# Altium project PCB_Project.PrjPcb
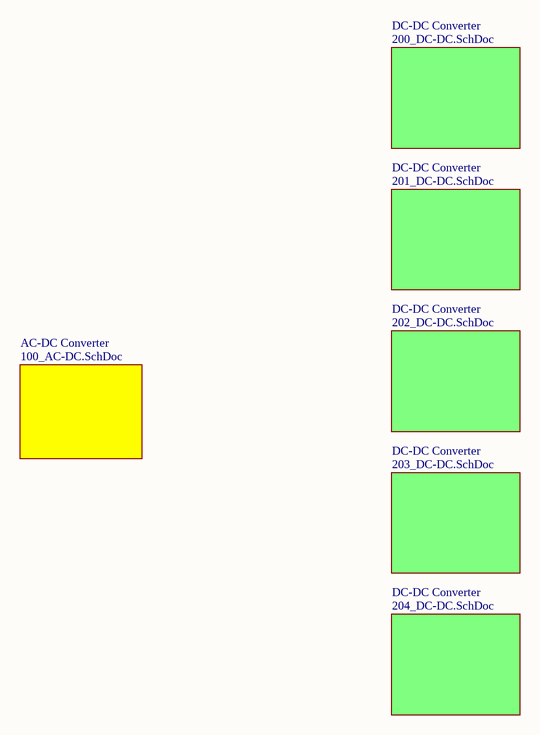
[diagram p0: 000_Hierarchical.SchDoc]
7 sheets, 69 parts. Net scope: global (net labels, ports and power ports of the same name join across sheets).
Board file: 100_AC-DC.PcbDoc
Sheets:
  000_Hierarchical.SchDoc
    AC-DC Converter = 100_AC-DC.SchDoc
    DC-DC Converter = 200_DC-DC.SchDoc
    DC-DC Converter = 202_DC-DC.SchDoc
    DC-DC Converter = 201_DC-DC.SchDoc
    DC-DC Converter = 203_DC-DC.SchDoc
    DC-DC Converter = 204_DC-DC.SchDoc

## Sheet 000_Hierarchical.SchDoc: Hierarchical system
size A4; Date: xxxxxx; Author: R.Ducuara; DrawnBy: J.Jaramillo; Revision: R1V0; SheetNumber: 1; SheetTotal: 7

### Sub-sheets
AC-DC Converter = 100_AC-DC.SchDoc: no entries
DC-DC Converter = 200_DC-DC.SchDoc: no entries
DC-DC Converter = 202_DC-DC.SchDoc: no entries
DC-DC Converter = 201_DC-DC.SchDoc: no entries
DC-DC Converter = 203_DC-DC.SchDoc: no entries
DC-DC Converter = 204_DC-DC.SchDoc: no entries

### Notes on the sheet
- Title:
- Project:
- File:
- Revision:
- Date:
- Size:
- A4
- Drawn by:

## Sheet 100_AC-DC.SchDoc: AC-DC Converter
size A4; Date: xxxxxx; Author: R.Ducuara; DrawnBy: J.Jaramillo; Revision: R1V0; SheetNumber: 2; SheetTotal: 7
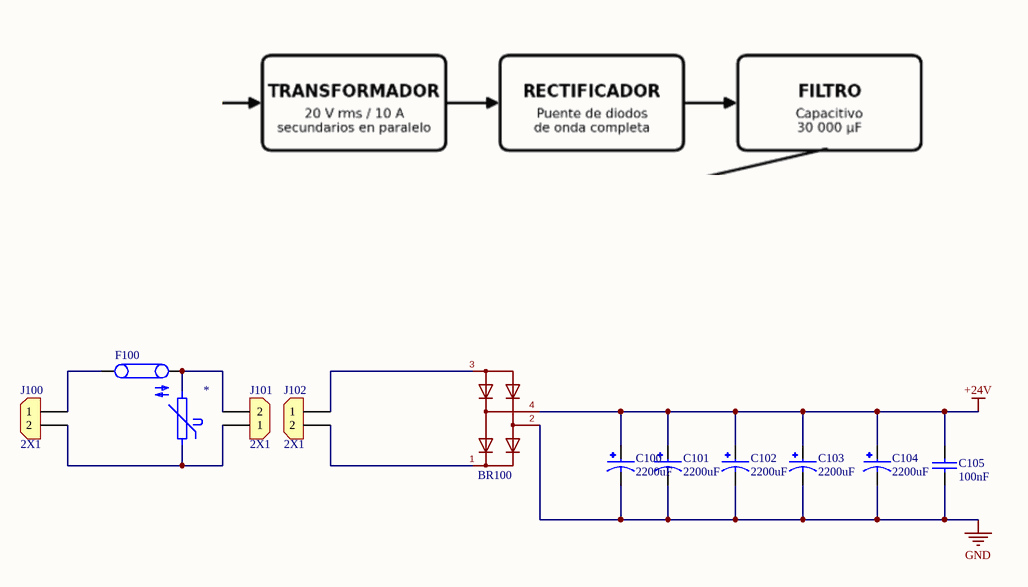
[diagram p1: 100_AC-DC.SchDoc]

### Parts
*  RV_Varistor_300VAC_125J_D14  [RV_Varistor_300VAC_125J_D14]  (value not drawn)
BR100  1000V 25A  [D_Bridge_1000V_25A_KBPC_FP]  (value not drawn)
C100  value 2200uF  [C_Alum_2200uF_50V_D18]  (hidden comment: C_Alum_2200uF_50V_D18)
C101  value 2200uF  [C_Alum_2200uF_50V_D18]  (hidden comment: C_Alum_2200uF_50V_D18)
C102  value 2200uF  [C_Alum_2200uF_50V_D18]  (hidden comment: C_Alum_2200uF_50V_D18)
C103  value 2200uF  [C_Alum_2200uF_50V_D18]  (hidden comment: C_Alum_2200uF_50V_D18)
C104  value 2200uF  [C_Alum_2200uF_50V_D18]  (hidden comment: C_Alum_2200uF_50V_D18)
C105  value 100nF  [1206]  (hidden comment: 100nF 100V)
F100  500V 10A  [FUSE_HLD_CARTRIDGE_5x20mm]  (value not drawn)
J100  2X1  [CON_2X1_TH_5MM_BAT]
J101  2X1  [CON_2X1_TH_5MM_BAT]
J102  2X1  [CON_2X1_TH_5MM_BAT]

### Nets
+24V: BR100.4(Input_~) C100.P C101.P C102.P C103.P C104.P C105.1
GND: BR100.2(Input_~) C100.N C101.N C102.N C103.N C104.N C105.2
Net*_1: *.1 J100.2 J101.1
Net*_2: *.2 F100.2 J101.2
NetBR100_1: BR100.1(+) J102.2
NetBR100_3: BR100.3(-) J102.1
NetF100_1: F100.1 J100.1

### Notes on the sheet
- Title:
- Project:
- File:
- Revision:
- Date:
- Size:
- A4
- Drawn by:

### Library data of the parts
* = RV_Varistor_300VAC_125J_D14: 470 V 6 kA Varistor 1 Circuitos Orificio pasante Tipo moneda 14mm; Manufacturer: TDK; Manufacturer Part Number: B72214P2301K101; Reel Sotck: N/A; Last modified by: R.Ducuara; Last modified date: 20261120
BR100 = D_Bridge_1000V_25A_KBPC_FP: Rectificador de puente Single Phase Estándar 1 kV Montaje de chasis KBPC FP; Manufacturer: Diotec Semiconductor; Manufacturer Part Number: KBPC10/15/2510FP; Supplier 1: Digikey; Supplier Part Number 1: 4878-KBPC10/15/2510FP-ND; Reel Stock: N/A; Last modified by: R.Ducuara; Last modified date: 20261120
C100-C104 = C_Alum_2200uF_50V_D18: Capacitores electrolíticos de aluminio 2200 µF 50 V Radial, encapsulado 2000 h a 105°C; Manufacturer: Panasonic Industry; Manufacturer Part Number: EEU-HD1H222; Supplier 1: Digi-Key; Supplier Part Number 1: P15152-ND; Last modified by: R.Ducuara; Last modified date: 20261120
C105 = Cap_0.1uF_1206_100V: CAP CER 0.1UF 100V X7R 1206; Manufacturer: Samsung Electro-Mechanics; Manufacturer Part Number: CL31B104KCFNNNE; Supplier 1: Digi-Key; Supplier Part Number 1: 1276-1151-1-ND; Last modified by: J.Jaramillo; Last modified date: 20240309; ComponentLink1Description: Digi-Key; ComponentLink1URL: https://www.digikey.com/en/products/detail/samsung-electro-mechanics/CL31B104KCFNNNE/3886809
F100 = F_HLD_CARTRIDGE_5x20mm: FUSE BLOK CARTRIDGE 500V 10A PCB; Manufacturer: Schurter Inc.; Manufacturer Part Number: 0031.8201; Supplier 1: Digi-Key; Supplier Part Number 1: 486-1258-ND; Reel Sotck: N/A; Last modified by: J.Jaramillo; Last modified date: 20240309; ComponentLink1Description: Digi-Key; ComponentLink1URL: https://www.digikey.com/en/products/detail/schurter-inc/0031-8201/669925?s=N4IgTCBcDaIAxwMwEYB0AOMdkgLoF8g
J100-J102 = Con_2x1_TH_5mm_Battery: Power Connectors ROHS; Manufacturer: Changzhou Amass Elec; Manufacturer Part Number: XT30U-M; Supplier 1: LCSC; Supplier Part Number 1: C99101; Reel Stock: N/A; Last modified by: J.Jaramillo; Last modified date: 20240310; ComponentLink1Description: Digi-Key; ComponentLink1URL: https://lcsc.com/product-detail/Power-Connectors_Changzhou-Amass-Elec-XT30U-M_C99101.html

## Sheet 200_DC-DC.SchDoc: DC_DC Convertion Stage
size A4; Date: xxxxxx; Author: R.Ducuara; DrawnBy: J.Jaramillo; Revision: R1V0; SheetNumber: 3; SheetTotal: 7
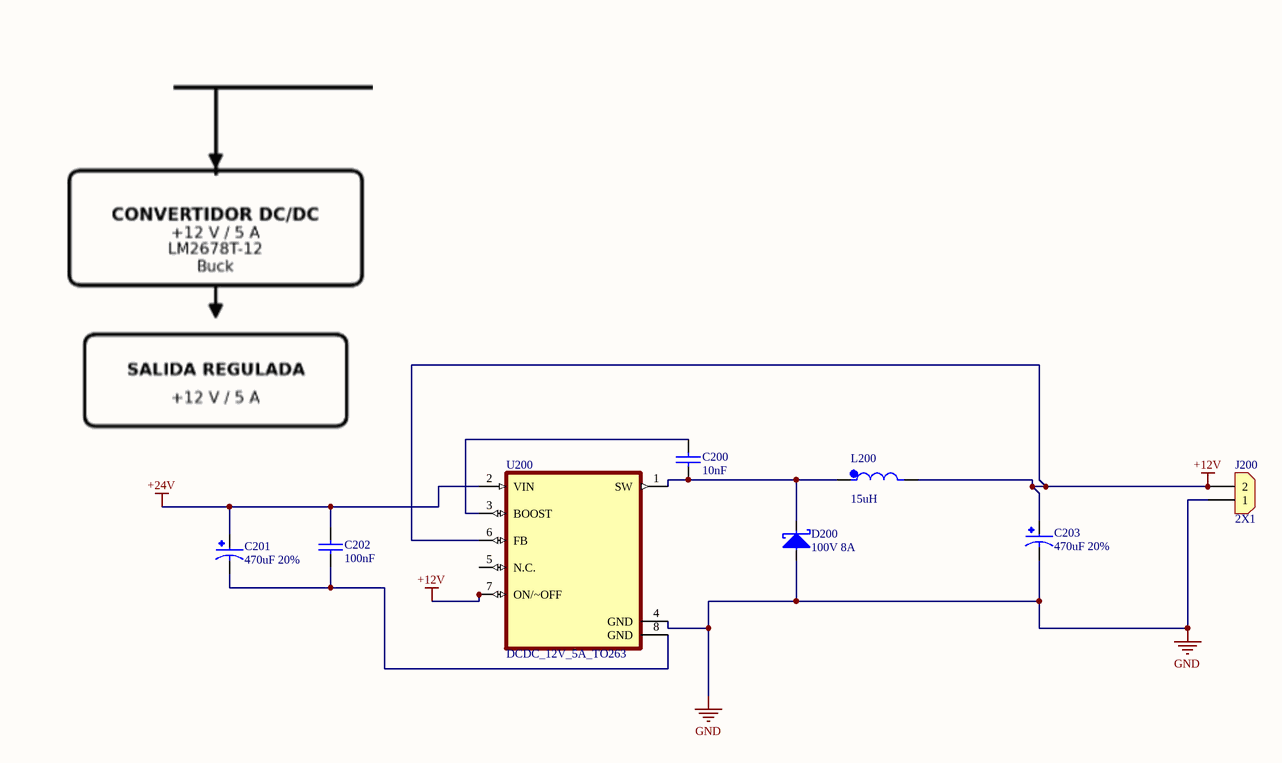
[diagram p2: 200_DC-DC.SchDoc]

### Parts
C200  value 10nF  [0805]  (hidden comment: 10000pF 50V)
C201  470uF 20%  [Cap_470uF_35V_ALUM_RAD]
C202  value 100nF  [1206]  (hidden comment: 100nF 100V)
C203  470uF 20%  [Cap_470uF_35V_ALUM_RAD]
D200  100V 8A  [DO_214AB]
J200  2X1  [CON_2X1_TH_5MM_BAT]
L200  15uH  [L_15uH_7A_SMD]
U200  DCDC_12V_5A_TO263  [DCDC_12V_5A_TO263]

### Nets
+12V: C203.P J200.2 L200.2 U200.6(FB) U200.7(ON/~OFF)
+24V: C201.P C202.1 U200.2(VIN)
GND: C203.N D200.2 J200.1 U200.4(GND)
NetC200_1: C200.1 U200.3(BOOST)
NetC200_2: C200.2 D200.1 L200.1 U200.1(SW)
NetC201_N: C201.N C202.2 U200.8(GND)

Not connected (* = marked no-connect by the designer): U200 5(N.C.)

### Notes on the sheet
- Title:
- Project:
- File:
- Revision:
- Date:
- Size:
- A4
- Drawn by:

### Library data of the parts
C200 = Cap_10000pF_0805_50V: CAP CER 10000PF 50V X7R 0805; Manufacturer: Yageo; Manufacturer Part Number: CC0805JRX7R9BB103; Supplier 1: Digi-Key; Supplier Part Number 1: 311-1857-1-ND; Reel stock: N/A; Last modified by: J.Jaramillo; Last modified date: 20240309; ComponentLink1Description: Digi-Key; ComponentLink1URL: https://www.digikey.com/product-detail/en/yageo/CC0805JRX7R9BB103/311-1857-1-ND/5195759
C201 C203 = Cap_470uF_35V_ALUM_RAD: CAP ALUM 470UF 20% 35V RADIAL TH; Manufacturer: Panasonic Industry; Manufacturer Part Number: ECA-1VM471B; Supplier 1: Digi-Key; Supplier Part Number 1: 10-ECA-1VM471BCT-ND; Last modified by: R.Ducuara; Last modified date: 20261121; Value: 470uF
C202 = Cap_0.1uF_1206_100V: as C105 on sheet 100_AC-DC; Supplier 1: Digi-Key; Supplier Part Number 1: 1276-1151-1-ND; Last modified by: J.Jaramillo; Last modified date: 20240309; ComponentLink1Description: Digi-Key; ComponentLink1URL: https://www.digikey.com/en/products/detail/samsung-electro-mechanics/CL31B104KCFNNNE/3886809
D200 = D_Schottky_100V_8A_DO_214AB: DIODE SCHOTTKY 100V 8A DO214AB; Manufacturer: Micro Commercial Co; Manufacturer Part Number: SK810L-TP; Supplier 1: Digi-key; Supplier Part Number 1: SK810L-TPMSCT-ND; Reel Stock: N/A; Last modified by: J.Jaramillo; Last modified date: 20240310; ComponentLink1Description: Digi-key; ComponentLink1URL: https://www.digikey.com/en/products/detail/micro-commercial-co/SK810L-TP/2650905?s=N4IgTCBcDaIMoGkAcBGADAGQLQBUAKIAugL5A
J200 = Con_2x1_TH_5mm_Battery: as J100 on sheet 100_AC-DC; Supplier 1: LCSC; Supplier Part Number 1: C99101; Reel Stock: N/A; Last modified by: J.Jaramillo; Last modified date: 20240310; ComponentLink1Description: Digi-Key; ComponentLink1URL: https://lcsc.com/product-detail/Power-Connectors_Changzhou-Amass-Elec-XT30U-M_C99101.html
L200 = L_15uH_7A_SMD: 15 µH Blindado Núcleo de tambor, cableado Inductivo 7 A 50mOhm máx. No estándar; Manufacturer: Bourns Inc.; Manufacturer Part Number: SRP1040VA-150M; Supplier 1: Digi-key; Supplier Part Number 1: 118-SRP1040VA-150MCT-ND; Reel Stock: N/A; Last modified by: R.Ducuara; Last modified date: 21/11/2026
U200 = DCDC_12V_5A_TO263: IC REG BUCK 12V 5A TO263; Manufacturer: Texas Instruments; Manufacturer Part Number: LM2678S-12; Supplier 1: Digikey; Supplier Part Number 1: LM2678S-12-ND; Reel Stock: N/A; Last modified by: R.Ducuara; Last modified date: 20261120

## Sheet 202_DC-DC.SchDoc: DC-DC
size A4; Date: XXXXXX; Author: R.Ducuara; DrawnBy: J.Jaramillo; Revision: R1V0; SheetNumber: 5; SheetTotal: 7
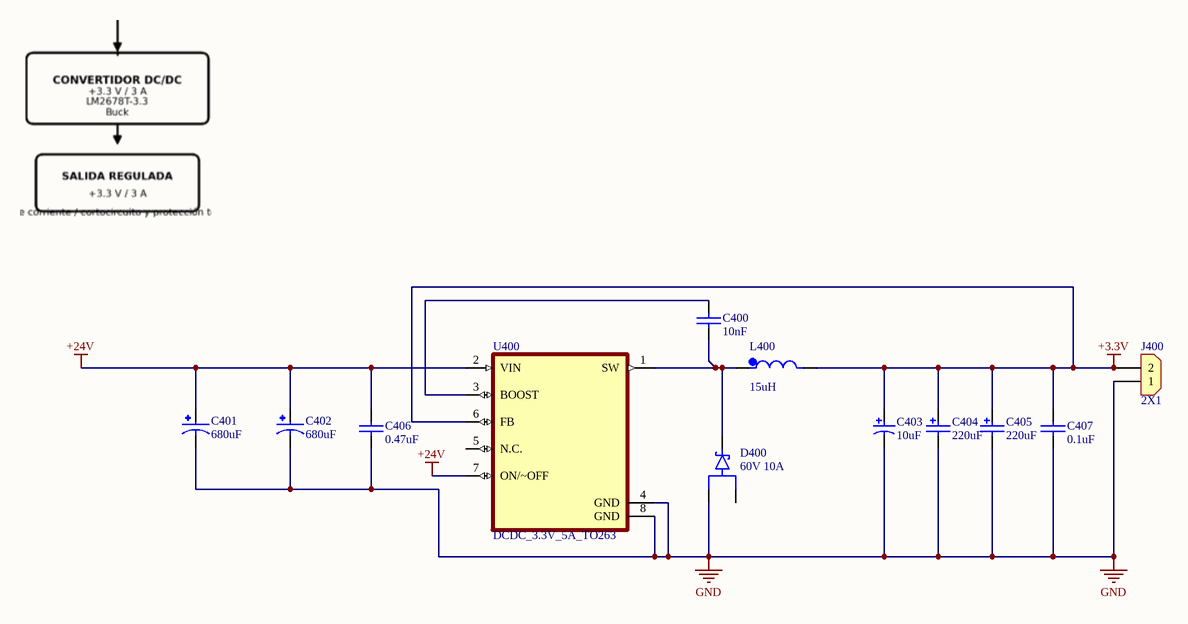
[diagram p3: 202_DC-DC.SchDoc]

### Parts
C400  value 10nF  [0603]  (hidden comment: 10nF 100V)
C401  value 680uF  [Cap_680uF_50V_ALUM_RAD]  (hidden comment: 680uF 50V)
C402  value 680uF  [Cap_680uF_50V_ALUM_RAD]  (hidden comment: 680uF 50V)
C403  value 10uF  [RADIAL-CAN-SMD_Diax4mm_Hx5.5mm]  (hidden comment: 10uF 10V)
C404  value 220uF  [RADIAL-CAN-SMD_Diax8mm_Hx10.2mm]  (hidden comment: 220uF 50V)
C405  value 220uF  [RADIAL-CAN-SMD_Diax8mm_Hx10.2mm]  (hidden comment: 220uF 50V)
C406  value 0.47uF  [0805]  (hidden comment: 0.47uF 50V)
C407  value 0.1uF  [0402_RF]  (hidden comment: 100nF 25V)
D400  60V 10A  [D_Schottky_30V_200mA_SOT23-3_1]
J400  2X1  [CON_2X1_TH_5MM_BAT]
L400  15uH  [L_15uH_7A_SMD]
U400  DCDC_3.3V_5A_TO263  [DCDC_3.3V_5A_TO263]

### Nets
+3.3V: C403.1 C404.1 C405.1 C407.1 J400.2 L400.2 U400.6(FB)
+24V: C401.P C402.P C406.1 U400.2(VIN) U400.7(ON/~OFF)
GND: C401.N C402.N C403.2 C404.2 C405.2 C406.2 C407.2 D400.1(A1) J400.1 U400.4(GND) U400.8(GND)
NetC400_1: C400.1 U400.3(BOOST)
NetC400_2: C400.2 D400.3(K) L400.1 U400.1(SW)

Not connected (* = marked no-connect by the designer): D400 2(A2); U400 5(N.C.)

### Notes on the sheet
- Title:
- Project:
- File:
- Revision:
- Date:
- Size:
- A4
- Drawn by:

### Library data of the parts
C400 = Cap_10000pF_0603_100V: CAP CER 10000PF 100V X7R 0603; Manufacturer: Walsin Technology Corporation; Manufacturer Part Number: 0603B103K101CT; Supplier 1: Digi-Key; Supplier Part Number 1: 1292-1383-1-ND; Last modified by: J.Jaramillo; Last modified date: 20240309; ComponentLink1Description: Digi-Key; ComponentLink1URL: https://www.digikey.com/en/products/detail/walsin-technology-corporation/0603B103K101CT/9354880?s=N4IgTCBcDaIIxgJxgLRwMwA51pQOQBEQBdAXyA
C401 C402 = Cap_680uF_50V_ALUM_RAD: Capacitores electrolíticos de aluminio 680 µF 50 V Radial, encapsulado 7000 h a 105°C; Manufacturer: Panasonic Industry; Manufacturer Part Number: EEU-FM1H681L; Last modified by: R,Ducuara; Last modified date: 20261120; Supplier 1: Avnet; Supplier Part Number 1: EEU-FM1H681L
C403 = Cap_10uF_10V_ALU_SMD: CAP ALUM 10UF 20% 10V SMD; Manufacturer: Würth Elektronik; Manufacturer Part Number: 865090240001; Supplier 1: Digi-Key; Supplier Part Number 1: 732-8394-1-ND; Last modified by: J.Jaramillo; Last modified date: 20240309; ComponentLink1Description: New link; ComponentLink1URL: https://www.digikey.com/en/products/detail/w%C3%BCrth-elektronik/865090240001/5727989?s=N4IgTCBcDaIOwGYwFoAcCCcAWZBGZAcgCIAEIAugL5A
C404 C405 = Cap_220uF_50V_ALU_SMD: CAP ALUM 220UF 20% 50V SMD; Manufacturer: Panasonic; Manufacturer Part Number: EEE-FT1H221AP; Supplier 1: Mouser; Supplier Part Number 1: 667-EEE-FT1H221AP; Reel stock: N/A; Last modified by: J.Jaramillo; Last modified date: 20240309; ComponentLink1Description: Mouser; ComponentLink1URL: https://www.mouser.com/ProductDetail/Panasonic/EEE-FT1H221AP?qs=CMJjuEs1%252BuFFGBuxQbDfDA==
C406 = Cap_0.47uF_0805_50V: CAP CER 0.47UF 50V X7R 0805; Manufacturer: KEMET; Manufacturer Part Number: C0805C474K5RACTU; Supplier 1: Digi-Key; Supplier Part Number 1: 399-8100-1-ND; Last modified by: J.Jaramillo; Last modified date: 20240309; ComponentLink1Description: Digi-Key; ComponentLink1URL: https://www.digikey.com/products/en?keywords=399-8100-1-ND
C407 = Cap_0.1uF_0402_25V: CAP CER 0.1UF 25V X7R 0402; Manufacturer: Yageo; Manufacturer Part Number: CC0402KRX7R8BB104; Last modified by: J.Jaramillo; Last modified date: 20240309; ComponentLink1Description: Digi-key; ComponentLink1URL: https://www.digikey.com/products/en?keywords=311-2077-1-ND; Supplier 1: Digi-Key; Supplier Part Number 1: 311-2077-1-ND
D400 = D_Schottky_60V_10A_ThinDPAK: DIODE SCHOTTKY 60V 10A THINDPAK; Manufacturer: Taiwan Semiconductor Corporation; Manufacturer Part Number: MBRAD1060H; Supplier 1: Digi-Key; Supplier Part Number 1: 1801-MBRAD1060HCT-ND; Reel Stock: N/A; Last modified by: R.Ducuara; Last modified date: 20261120; ComponentLink1Description: Digi-Key; ComponentLink1URL: https://www.digikey.com/en/products/detail/onsemi/SBAT54SLT1G/3062594
J400 = Con_2x1_TH_5mm_Battery: as J100 on sheet 100_AC-DC; Supplier 1: LCSC; Supplier Part Number 1: C99101; Reel Stock: N/A; Last modified by: J.Jaramillo; Last modified date: 20240310; ComponentLink1Description: Digi-Key; ComponentLink1URL: https://lcsc.com/product-detail/Power-Connectors_Changzhou-Amass-Elec-XT30U-M_C99101.html
L400 = L_15uH_7A_SMD: as L200 on sheet 200_DC-DC; Supplier 1: Digi-key; Supplier Part Number 1: 118-SRP1040VA-150MCT-ND; Reel Stock: N/A; Last modified by: R.Ducuara; Last modified date: 21/11/2026
U400 = DCDC_3.3V_5A_TO263: IC REG BUCK 3.3V 5A TO263; Manufacturer: Texas Instruments; Manufacturer Part Number: LM2678S-3.3; Supplier 1: Digikey; Supplier Part Number 1: LM2678S-3.3-ND; Reel Stock: N/A; Last modified by: R.Ducuara; Last modified date: 20261120

## Sheet 201_DC-DC.SchDoc: DC-DC
size A4; Date: xxxxxx; Author: R.Ducuara; DrawnBy: J.Jaramillo; Revision: R1V0; SheetNumber: 4; SheetTotal: 7
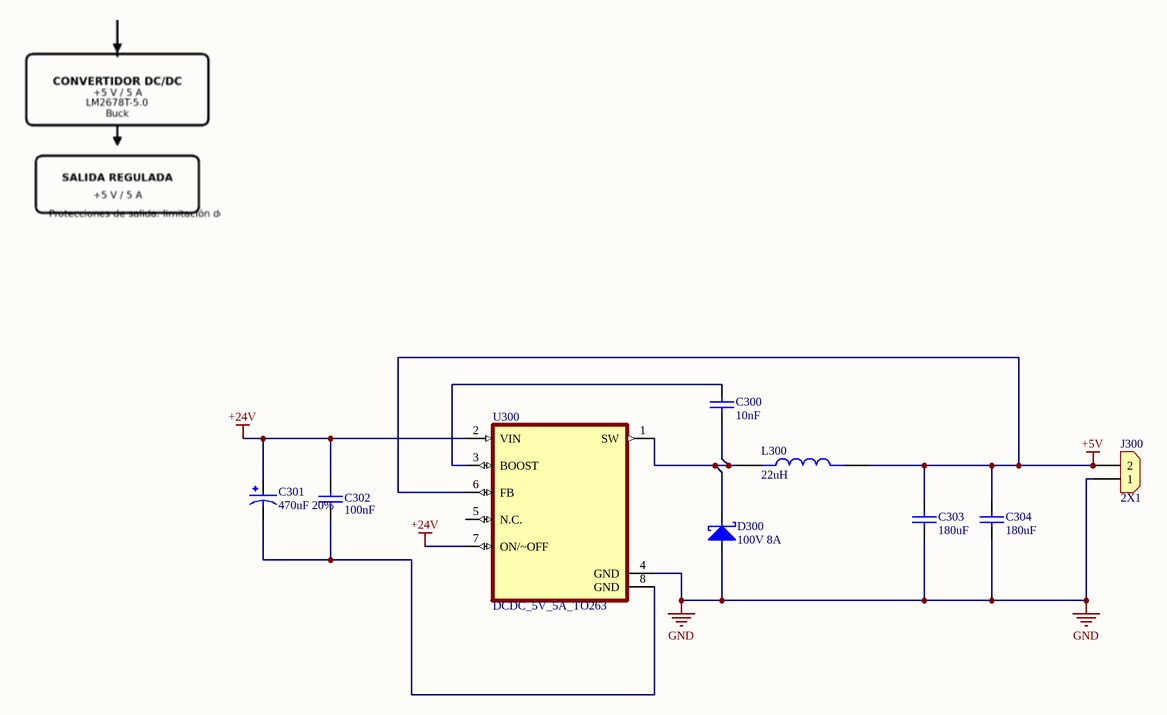
[diagram p4: 201_DC-DC.SchDoc]

### Parts
C300  value 10nF  [0805]  (hidden comment: 10000pF 50V)
C301  470uF 20%  [Cap_470uF_35V_ALUM_RAD]
C302  value 100nF  [1206]  (hidden comment: 100nF 100V)
C303  180uF  [Cap_180uF_16V_ALU_SMD]
C304  180uF  [Cap_180uF_16V_ALU_SMD]
D300  100V 8A  [DO_214AB]
J300  2X1  [CON_2X1_TH_5MM_BAT]
L300  value 22uH  [L_22uH_5A_SMD_FIXED]  (hidden comment: 22uH 5A)
U300  DCDC_5V_5A_TO263  [DCDC_5V_5A_TO263]

### Nets
+5V: C303.1 C304.1 J300.2 L300.2 U300.6(FB)
+24V: C301.P C302.1 U300.2(VIN) U300.7(ON/~OFF)
GND: C303.2 C304.2 D300.2 J300.1 U300.4(GND)
NetC300_1: C300.1 U300.3(BOOST)
NetC300_2: C300.2 D300.1 L300.1 U300.1(SW)
NetC301_N: C301.N C302.2 U300.8(GND)

Not connected (* = marked no-connect by the designer): U300 5(N.C.)

### Notes on the sheet
- Title:
- Project:
- File:
- Revision:
- Date:
- Size:
- A4
- Drawn by:

### Library data of the parts
C300 = Cap_10000pF_0805_50V: as C200 on sheet 200_DC-DC; Supplier 1: Digi-Key; Supplier Part Number 1: 311-1857-1-ND; Reel stock: N/A; Last modified by: J.Jaramillo; Last modified date: 20240309; ComponentLink1Description: Digi-Key; ComponentLink1URL: https://www.digikey.com/product-detail/en/yageo/CC0805JRX7R9BB103/311-1857-1-ND/5195759
C301 = Cap_470uF_35V_ALUM_RAD: as C201 on sheet 200_DC-DC; Supplier 1: Digi-Key; Supplier Part Number 1: 10-ECA-1VM471BCT-ND; Last modified by: R.Ducuara; Last modified date: 20261121; Value: 470uF
C302 = Cap_0.1uF_1206_100V: as C105 on sheet 100_AC-DC; Supplier 1: Digi-Key; Supplier Part Number 1: 1276-1151-1-ND; Last modified by: J.Jaramillo; Last modified date: 20240309; ComponentLink1Description: Digi-Key; ComponentLink1URL: https://www.digikey.com/en/products/detail/samsung-electro-mechanics/CL31B104KCFNNNE/3886809
C303 C304 = Cap_180uF_16V_ALU_SMD: CAP ALUM POLY 180UF 20% 16V SMD; Manufacturer: Würth Elektronik; Manufacturer Part Number: 875075355001; Reel stock: Digikey; Last modified by: R.Ducuara; Last modified date: 20240309; Supplier 1: Newark; Supplier Part Number 1: 875075355001; Value: 180uF
D300 = D_Schottky_100V_8A_DO_214AB: as D200 on sheet 200_DC-DC; Supplier 1: Digi-key; Supplier Part Number 1: SK810L-TPMSCT-ND; Reel Stock: N/A; Last modified by: J.Jaramillo; Last modified date: 20240310; ComponentLink1Description: Digi-key; ComponentLink1URL: https://www.digikey.com/en/products/detail/micro-commercial-co/SK810L-TP/2650905?s=N4IgTCBcDaIMoGkAcBGADAGQLQBUAKIAugL5A
J300 = Con_2x1_TH_5mm_Battery: as J100 on sheet 100_AC-DC; Supplier 1: LCSC; Supplier Part Number 1: C99101; Reel Stock: N/A; Last modified by: J.Jaramillo; Last modified date: 20240310; ComponentLink1Description: Digi-Key; ComponentLink1URL: https://lcsc.com/product-detail/Power-Connectors_Changzhou-Amass-Elec-XT30U-M_C99101.html
L300 = L_22uH_5A_SMD_FIXED: 22 µH Blindado Moldeado Inductivo 5 A 74mOhm máx. No estándar; Manufacturer: Abracon LLC; Manufacturer Part Number: AMPLA1004S-220MT; Supplier 1: Digi-Key; Supplier Part Number 1: AMPLA1004S-220MT; Reel Stock: N/A; Last modified by: R.Ducuara; Last modified date: 20261120
U300 = DCDC_5V_5A_TO263: IC REG BUCK 5V 5A TO263; Manufacturer: Texas Instruments; Manufacturer Part Number: LM2678S-5.0; Supplier 1: Digikey; Supplier Part Number 1: LM2678S-5.0-ND; Reel Stock: N/A; Last modified by: R.Ducuara; Last modified date: 20261120

## Sheet 203_DC-DC.SchDoc: DC-DC
size A4; Date: XXXXXX; Author: R.Ducuara; DrawnBy: J.Jaramillo; Revision: R1V0; SheetNumber: 6; SheetTotal: 7
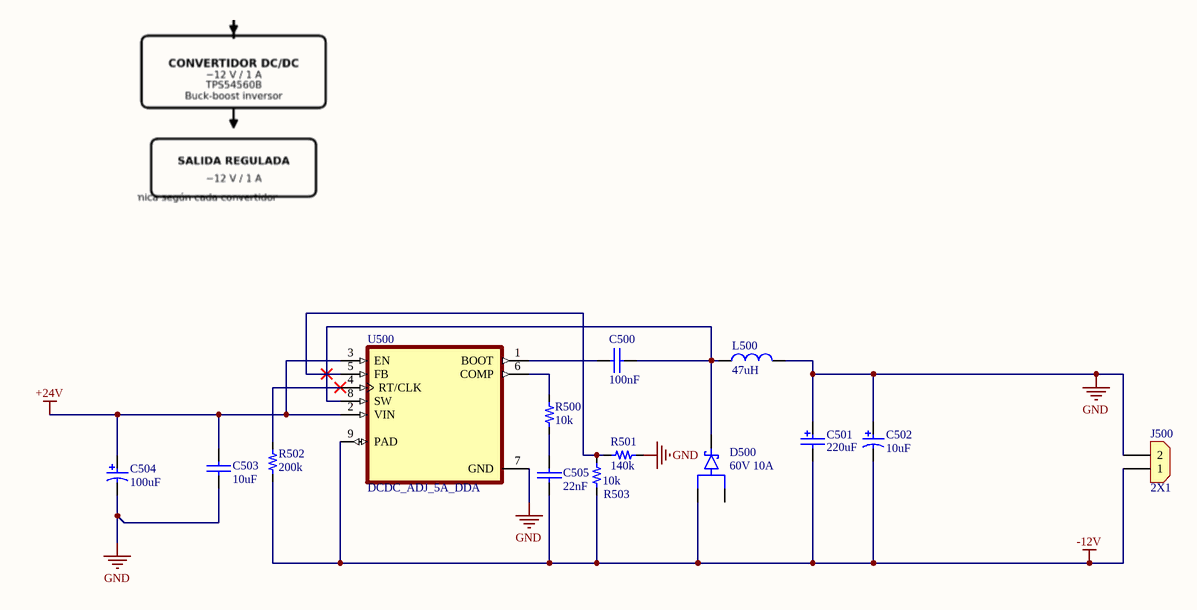
[diagram p5: 203_DC-DC.SchDoc]

### Parts
C500  value 100nF  [1206]  (hidden comment: 100nF 100V)
C501  value 220uF  [RADIAL-CAN-SMD_Diax8mm_Hx10.2mm]  (hidden comment: 220uF 35V)
C502  value 10uF  [RADIAL-CAN-SMD_Diax4mm_Hx5.5mm]  (hidden comment: 10uF 25V)
C503  value 10uF  [1206]  (hidden comment: 10uF 50V)
C504  value 100uF  [RADIAL-CAN-SMD_Diax8mm_Hx10.2mm]  (hidden comment: 100uF 25V)
C505  value 22nF  [0402_1.0mm]  (hidden comment: 22nF 25V)
D500  60V 10A  [D_Schottky_30V_200mA_SOT23-3_1]
J500  2X1  [CON_2X1_TH_5MM_BAT]
L500  value 47uH  [L_2SMD_11.5x10X4MM]  (hidden comment: 47uH 3A)
R500  value 10k  [0603]  (hidden comment: 10k 1/10W)
R501  value 140k  [0603]  (hidden comment: 140K 1/10W)
R502  value 200k  [1206]  (hidden comment: 200k 1/4W)
R503  value 10k  [0603]  (hidden comment: 10k 1/10W)
U500  DCDC_ADJ_5A_DDA  [DCDC_ADJ_5A_DDA]

### Nets
+24V: C503.1 C504.1 U500.2(VIN) U500.3(EN)
-12V: C501.2 C502.2 C505.2 D500.1(A1) J500.1 R502.1 R503.1 U500.9(PAD)
GND: C501.1 C502.1 C503.2 C504.2 J500.2 L500.2 R501.2 U500.7(GND)
NetC500_1: C500.1 U500.1(BOOT)
NetC500_2: C500.2 D500.3(K) L500.1 U500.8(SW)
NetC505_1: C505.1 R500.1
NetR500_2: R500.2 U500.6(COMP)
NetR501_1: R501.1 R503.2 U500.5(FB)
NetR502_2: R502.2 U500.4(RT/CLK)

Not connected (* = marked no-connect by the designer): D500 2(A2)

### Notes on the sheet
- Title:
- Project:
- File:
- Revision:
- Date:
- Size:
- A4
- Drawn by:

### Library data of the parts
C500 = Cap_0.1uF_1206_100V: as C105 on sheet 100_AC-DC; Supplier 1: Digi-Key; Supplier Part Number 1: 1276-1151-1-ND; Last modified by: J.Jaramillo; Last modified date: 20240309; ComponentLink1Description: Digi-Key; ComponentLink1URL: https://www.digikey.com/en/products/detail/samsung-electro-mechanics/CL31B104KCFNNNE/3886809
C501 = Cap_220uF_35V_ALU_SMD_1: CAP ALUM 220UF 20% 35V SMD; Manufacturer: Panasonic Electronic Components; Manufacturer Part Number: EEE-1VA221UP; Supplier 1: Digi-Key; Supplier Part Number 1: PCE3955CT-ND; Reel stock: N/A; Last modified by: J.Jaramillo; Last modified date: 20240309; ComponentLink1Description: Digi-Key; ComponentLink1URL: https://www.digikey.com/products/en?keywords=PCE3955CT-ND
C502 = Cap_10uF_25V_ALU_SMD: CAP ALUM 10UF 20% 25V SMD; Manufacturer: Würth Elektronik; Manufacturer Part Number: 865080440002; Last modified by: J.Jaramillo; Last modified date: 20240309; ComponentLink1Description: Digi-Key; ComponentLink1URL: https://www.digikey.com/product-detail/en/w-rth-elektronik/865080440002/732-8430-1-ND/5728387; Supplier 1: Digi-Key; Supplier Part Number 1: 732-8430-1-ND
C503 = Cap_10uF_1206_50V: CAP CER 10UF 50V X5R 1206; Manufacturer: Murata Electronics North America; Manufacturer Part Number: GRT31CR61H106ME01L; Last modified by: J.Jaramillo; Last modified date: 20240309; ComponentLink1Description: Digi-Key; ComponentLink1URL: https://www.digikey.com/product-detail/en/murata-electronics-north-america/GRT31CR61H106ME01L/490-12457-1-ND/5417158; Supplier 1: Digi-Key; Supplier Part Number 1: 490-12457-1-ND
C504 = Cap_100uF_25V_ALU_SMD: CAP ALUM 100UF 20% 25V SMD; Manufacturer: Panasonic Electronic Components; Manufacturer Part Number: EEE-1EA101AP; Supplier 1: Digi-Key; Supplier Part Number 1: PCE4593CT-ND; Last modified by: J.Jaramillo; Last modified date: 20240309; ComponentLink1Description: Digi-Key; ComponentLink1URL: https://www.digikey.com/product-detail/en/panasonic-electronic-components/EEE-1EA101AP/PCE4593CT-ND/1718016
C505 = Cap_0.022uF_0402_25V: CAP CER 0.022UF 25V X7R 0402; Manufacturer: Murata Electronics North America; Manufacturer Part Number: GRM155R71E223KA61D; Supplier 1: Digi-Key; Supplier Part Number 1: 490-3252-1-ND; Last modified by: J.Jaramillo; Last modified date: 20240309; ComponentLink1Description: Digi-key; ComponentLink1URL: https://www.digikey.com/en/products/detail/murata-electronics/GRM155R71E223KA61D/702517?s=N4IgTCBcDaIOICUCyBGArGhB2FBRMYAzANICCAbCgCIgC6AvkA
D500 = D_Schottky_60V_10A_ThinDPAK: as D400 on sheet 202_DC-DC; Supplier 1: Digi-Key; Supplier Part Number 1: 1801-MBRAD1060HCT-ND; Reel Stock: N/A; Last modified by: R.Ducuara; Last modified date: 20261120; ComponentLink1Description: Digi-Key; ComponentLink1URL: https://www.digikey.com/en/products/detail/onsemi/SBAT54SLT1G/3062594
J500 = Con_2x1_TH_5mm_Battery: as J100 on sheet 100_AC-DC; Supplier 1: LCSC; Supplier Part Number 1: C99101; Reel Stock: N/A; Last modified by: J.Jaramillo; Last modified date: 20240310; ComponentLink1Description: Digi-Key; ComponentLink1URL: https://lcsc.com/product-detail/Power-Connectors_Changzhou-Amass-Elec-XT30U-M_C99101.html
L500 = L_47uH_3A_SMD_11.5x10MM: 3A 47uH 4,5A 155mÎ© Â±20% SMD,11,5x10mm Fixed Inductors RoHS; Manufacturer: Shun Xiang Nuo; Manufacturer Part Number: SMMS1040-470M; Supplier 1: LCSC; Supplier Part Number 1: C149599; Reel Stock: N/A; Last modified by: J.Jaramillo; Last modified date: 270326; ComponentLink1Description: Datasheet; ComponentLink1URL: https://www.lcsc.com/datasheet/C149599.pdf; ComponentLink2Description: LCSC; ComponentLink2URL: https://www.lcsc.com/product-detail/C149599.html
R500 R503 = Res_10k_0603_1/10W: RES SMD 10K OHM 1% 1/10W 0603; Manufacturer: Samsung Electro-Mechanics; Manufacturer Part Number: RC1608F103CS; ComponentLink1URL: https://www.digikey.com/products/en?keywords=1276-3485-1-ND; Supplier 1: Digi-Key; Supplier Part Number 1: 1276-3485-1-ND; Reel Stock: N/A; Last modified by: J.Jaramillo; Last modified date: 20240310; ComponentLink1Description: Digi-key
R501 = Res_140K_0603_1/10W_1%: RES SMD 140K OHM 1% 1/10W 0603; Manufacturer: Yageo; Manufacturer Part Number: RC0603FR-07140KL; Supplier 1: Digi-Key; Supplier Part Number 1: 311-140KHRCT-ND; Reel Stock: N/A; Last modified by: J.Jaramillo; Last modified date: 20240310; ComponentLink1Description: Digi-Key; ComponentLink1URL: https://www.digikey.com/en/products/detail/yageo/RC0603FR-07140KL/726947?s=N4IgTCBcDaIEoGEAMA2JBmAYnAtEg7AIwAsSA0gDIgC6AvkA
R502 = Res_200k_1206_1/4W: RES 200K OHM 1% 1/4W 1206; Manufacturer: Stackpole Electronics Inc; Manufacturer Part Number: RMCF1206FT200K; Supplier 1: Digi-Key; Supplier Part Number 1: RMCF1206FT200KTR-ND; Reel Stock: N/A; Last modified by: J.Jaramillo; Last modified date: 20240310; ComponentLink1Description: Digi-Key; ComponentLink1URL: https://www.digikey.com/product-detail/en/stackpole-electronics-inc/RMCF1206FT200K/RMCF1206FT200KTR-ND/1759778
U500 = DCDC_ADJ_5A_DDA: IC REG BCK SPLIT RAIL ADJ 8SOPWR; Manufacturer: Texas Instruments; Manufacturer Part Number: TPS54560BDDA; Supplier 1: Digikey; Supplier Part Number 1: 296-TPS54560BDDA-ND; Reel Stock: N/A; Last modified by: R.Ducuara; Last modified date: 20261120

## Sheet 204_DC-DC.SchDoc: DC-DC
size A4; Date: XXXXXX; Author: R.Ducuara; DrawnBy: J.Jaramillo; Revision: R1V0; SheetNumber: 7; SheetTotal: 7
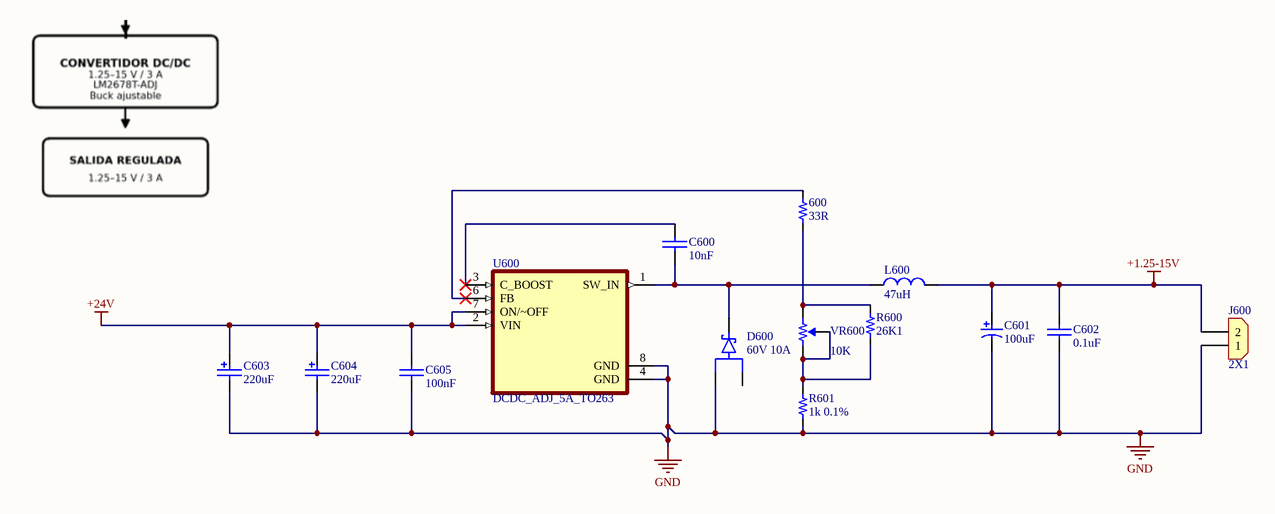
[diagram p6: 204_DC-DC.SchDoc]

### Parts
600  value 33R  [2512]  (hidden comment: 33R 2W)
C600  value 10nF  [0402]  (hidden comment: 10nF 50V)
C601  value 100uF  [RADIAL-CAN-SMD_Diax8mm_Hx10.2mm]  (hidden comment: 100uF 25V)
C602  value 0.1uF  [0603]  (hidden comment: 100nF 25V)
C603  value 220uF  [RADIAL-CAN-SMD_Diax8mm_Hx10.2mm]  (hidden comment: 220uF 50V)
C604  value 220uF  [RADIAL-CAN-SMD_Diax8mm_Hx10.2mm]  (hidden comment: 220uF 50V)
C605  value 100nF  [1206]  (hidden comment: 100nF 100V)
D600  60V 10A  [D_Schottky_30V_200mA_SOT23-3_1]
J600  2X1  [CON_2X1_TH_5MM_BAT]
L600  value 47uH  [L_2SMD_11.5x10X4MM]  (hidden comment: 47uH 3A)
R600  value 26K1  [0603]  (hidden comment: 1/10W)
R601  value 1k 0.1%  [0603]  (hidden comment: 1k 1/10W)
U600  DCDC_ADJ_5A_TO263  [DCDC_ADJ_5A_TO263]
VR600  value 10K  [Pot_3x1_5mm_TH]  (hidden comment: 10k 1/5W)

### Nets
+1.25-15V: C601.1 C602.1 J600.2 L600.2
+24V: C603.1 C604.1 C605.1 U600.2(VIN) U600.7(ON/~OFF)
GND: C601.2 C602.2 C603.2 C604.2 C605.2 D600.1(A1) J600.1 R601.1 U600.4(GND) U600.8(GND)
Net600_1: 600.1 U600.6(FB)
Net600_2: 600.2 R600.1 VR600.1
NetC600_1: C600.1 U600.3(C_BOOST)
NetC600_2: C600.2 D600.3(K) L600.1 U600.1(SW_IN)
NetR600_2: R600.2 R601.2 VR600.2 VR600.3

Not connected (* = marked no-connect by the designer): D600 2(A2)

### Notes on the sheet
- Title:
- Project:
- File:
- Revision:
- Date:
- Size:
- A4
- Drawn by:

### Library data of the parts
600 = Res_33R_2512_2W: RES SMD 33 OHM 1% 2W 2512; Manufacturer Part Number: CRM2512-FX-33R0ELF; Manufacturer: Bourns Inc.; Reel Stock: N/A; Last modified by: J.Jaramillo; Last modified date: 20240310; ComponentLink1Description: Digi-Key; ComponentLink1URL: https://www.digikey.com/product-detail/en/bourns-inc/CRM2512-FX-33R0ELF/CRM2512-FX-33R0ELFCT-ND/5775020; Supplier 1: Digi-Key; Supplier Part Number 1: CRM2512-FX-33R0ELFCT-ND
C600 = Cap_10000pF_0402_50V: CAP CER 10000PF 50V X7R 0402; Manufacturer: Murata Electronics North America; Manufacturer Part Number: GCM155R71H103KA55D; Supplier 1: Digi-Key; Supplier Part Number 1: 490-4762-1-ND; Reel stock: N/A; Last modified by: J.Jaramillo; Last modified date: 20240309; ComponentLink1Description: Digi-Key; ComponentLink1URL: https://www.digikey.com/product-detail/en/murata-electronics-north-america/GCM155R71H103KA55D/490-4762-1-ND/1641681
C601 = Cap_100uF_25V_ALU_SMD: as C504 on sheet 203_DC-DC; Supplier 1: Digi-Key; Supplier Part Number 1: PCE4593CT-ND; Last modified by: J.Jaramillo; Last modified date: 20240309; ComponentLink1Description: Digi-Key; ComponentLink1URL: https://www.digikey.com/product-detail/en/panasonic-electronic-components/EEE-1EA101AP/PCE4593CT-ND/1718016
C602 = Cap_0.1uF_0603_25V: CAP CER 0.1UF 25V X7R 0603; Manufacturer: TDK; Manufacturer Part Number: CGA3E2X7R1E104K080AA; Last modified by: J.Jaramillo; Last modified date: 20240309; ComponentLink1Description: Digi-key; ComponentLink1URL: https://www.digikey.com/en/products/detail/tdk-corporation/CGA3E2X7R1E104K080AA/2443145?s=N4IgTCBcDaIMIHECCBmAomAGgdgEoEY18AGAFgGliAOYpJEAXQF8g; Supplier 1: Digi-Key; Supplier Part Number 1: 445-5667-1-ND
C603 C604 = Cap_220uF_50V_ALU_SMD: as C404 on sheet 202_DC-DC; Supplier 1: Mouser; Supplier Part Number 1: 667-EEE-FT1H221AP; Reel stock: N/A; Last modified by: J.Jaramillo; Last modified date: 20240309; ComponentLink1Description: Mouser; ComponentLink1URL: https://www.mouser.com/ProductDetail/Panasonic/EEE-FT1H221AP?qs=CMJjuEs1%252BuFFGBuxQbDfDA==
C605 = Cap_0.1uF_1206_100V: as C105 on sheet 100_AC-DC; Supplier 1: Digi-Key; Supplier Part Number 1: 1276-1151-1-ND; Last modified by: J.Jaramillo; Last modified date: 20240309; ComponentLink1Description: Digi-Key; ComponentLink1URL: https://www.digikey.com/en/products/detail/samsung-electro-mechanics/CL31B104KCFNNNE/3886809
D600 = D_Schottky_60V_10A_ThinDPAK: as D400 on sheet 202_DC-DC; Supplier 1: Digi-Key; Supplier Part Number 1: 1801-MBRAD1060HCT-ND; Reel Stock: N/A; Last modified by: R.Ducuara; Last modified date: 20261120; ComponentLink1Description: Digi-Key; ComponentLink1URL: https://www.digikey.com/en/products/detail/onsemi/SBAT54SLT1G/3062594
J600 = Con_2x1_TH_5mm_Battery: as J100 on sheet 100_AC-DC; Supplier 1: LCSC; Supplier Part Number 1: C99101; Reel Stock: N/A; Last modified by: J.Jaramillo; Last modified date: 20240310; ComponentLink1Description: Digi-Key; ComponentLink1URL: https://lcsc.com/product-detail/Power-Connectors_Changzhou-Amass-Elec-XT30U-M_C99101.html
L600 = L_47uH_3A_SMD_11.5x10MM: as L500 on sheet 203_DC-DC; Supplier 1: LCSC; Supplier Part Number 1: C149599; Reel Stock: N/A; Last modified by: J.Jaramillo; Last modified date: 270326; ComponentLink1Description: Datasheet; ComponentLink1URL: https://www.lcsc.com/datasheet/C149599.pdf; ComponentLink2Description: LCSC; ComponentLink2URL: https://www.lcsc.com/product-detail/C149599.html
R600 = Res_26k1_0603_1/10W: RES SMD 26.1K OHM 1% 1/10W 0603; Manufacturer: Yageo; Manufacturer Part Number: AC0603FR-0726K1L; Reel Stock: N/A; Last modified by: J.Jaramillo; Last modified date: 20240310; ComponentLink1Description: Digi-Key; ComponentLink1URL: https://www.digikey.com/en/products/detail/yageo/AC0603FR-0726K1L/5895956; Supplier 1: Digi-Key; Supplier Part Number 1: 13-AC0603FR-0726K1LCT-ND
R601 = Res_1k_0603_1/10W_0.1%: RES SMD 1K OHM 0.1% 1/10W 0603; Manufacturer: Panasonic Electronic Components; Manufacturer Part Number: ERA-3AEB102V; Supplier 1: Digi-Key; Supplier Part Number 1: P1.0KDBCT-ND; Reel Stock: N/A; Last modified by: J.Jaramillo; Last modified date: 20240310; ComponentLink1Description: Digi-Key; ComponentLink1URL: https://www.digikey.com/en/products/detail/panasonic-electronic-components/ERA-3AEB102V/1465854
U600 = DCDC_ADJ_5A_TO263: IC REG BUCK ADJ 5A TO263; Manufacturer: Texas Instruments; Manufacturer Part Number: LM2678S-ADJ; Supplier 1: Digikey; Supplier Part Number 1: LM2678S-ADJ-ND; Reel Stock: N/A; Last modified by: R.Ducuara; Last modified date: 20261120
VR600 = Pot_10k_1/5W_TH: POT 10K OHM 1/5W PLASTIC LINEAR; Manufacturer: TT Electronics/BI; Manufacturer Part Number: P160KN-0QC15B10K; Reel Stock: N/A; Last modified by: J.Jaramillo; Last modified date: 20240310; ComponentLink1Description: Digi-key; ComponentLink1URL: https://www.digikey.com/products/en?keywords=P160KN-0QC15B10K; Supplier 1: Digi-Key; Supplier Part Number 1: 987-1301-ND

## Nets that join several sheets
+24V: 100_AC-DC (7 pins), 200_DC-DC (C201.P C202.1 U200.2), 202_DC-DC (5 pins), 201_DC-DC (C301.P C302.1 U300.2 U300.7), 203_DC-DC (C503.1 C504.1 U500.2 U500.3), 204_DC-DC (5 pins)
GND: 100_AC-DC (7 pins), 200_DC-DC (C203.N D200.2 J200.1 U200.4), 202_DC-DC (11 pins), 201_DC-DC (5 pins), 203_DC-DC (8 pins), 204_DC-DC (10 pins)